# EAGLE design ASCEND_Logger (EAGLE 9.7.0)
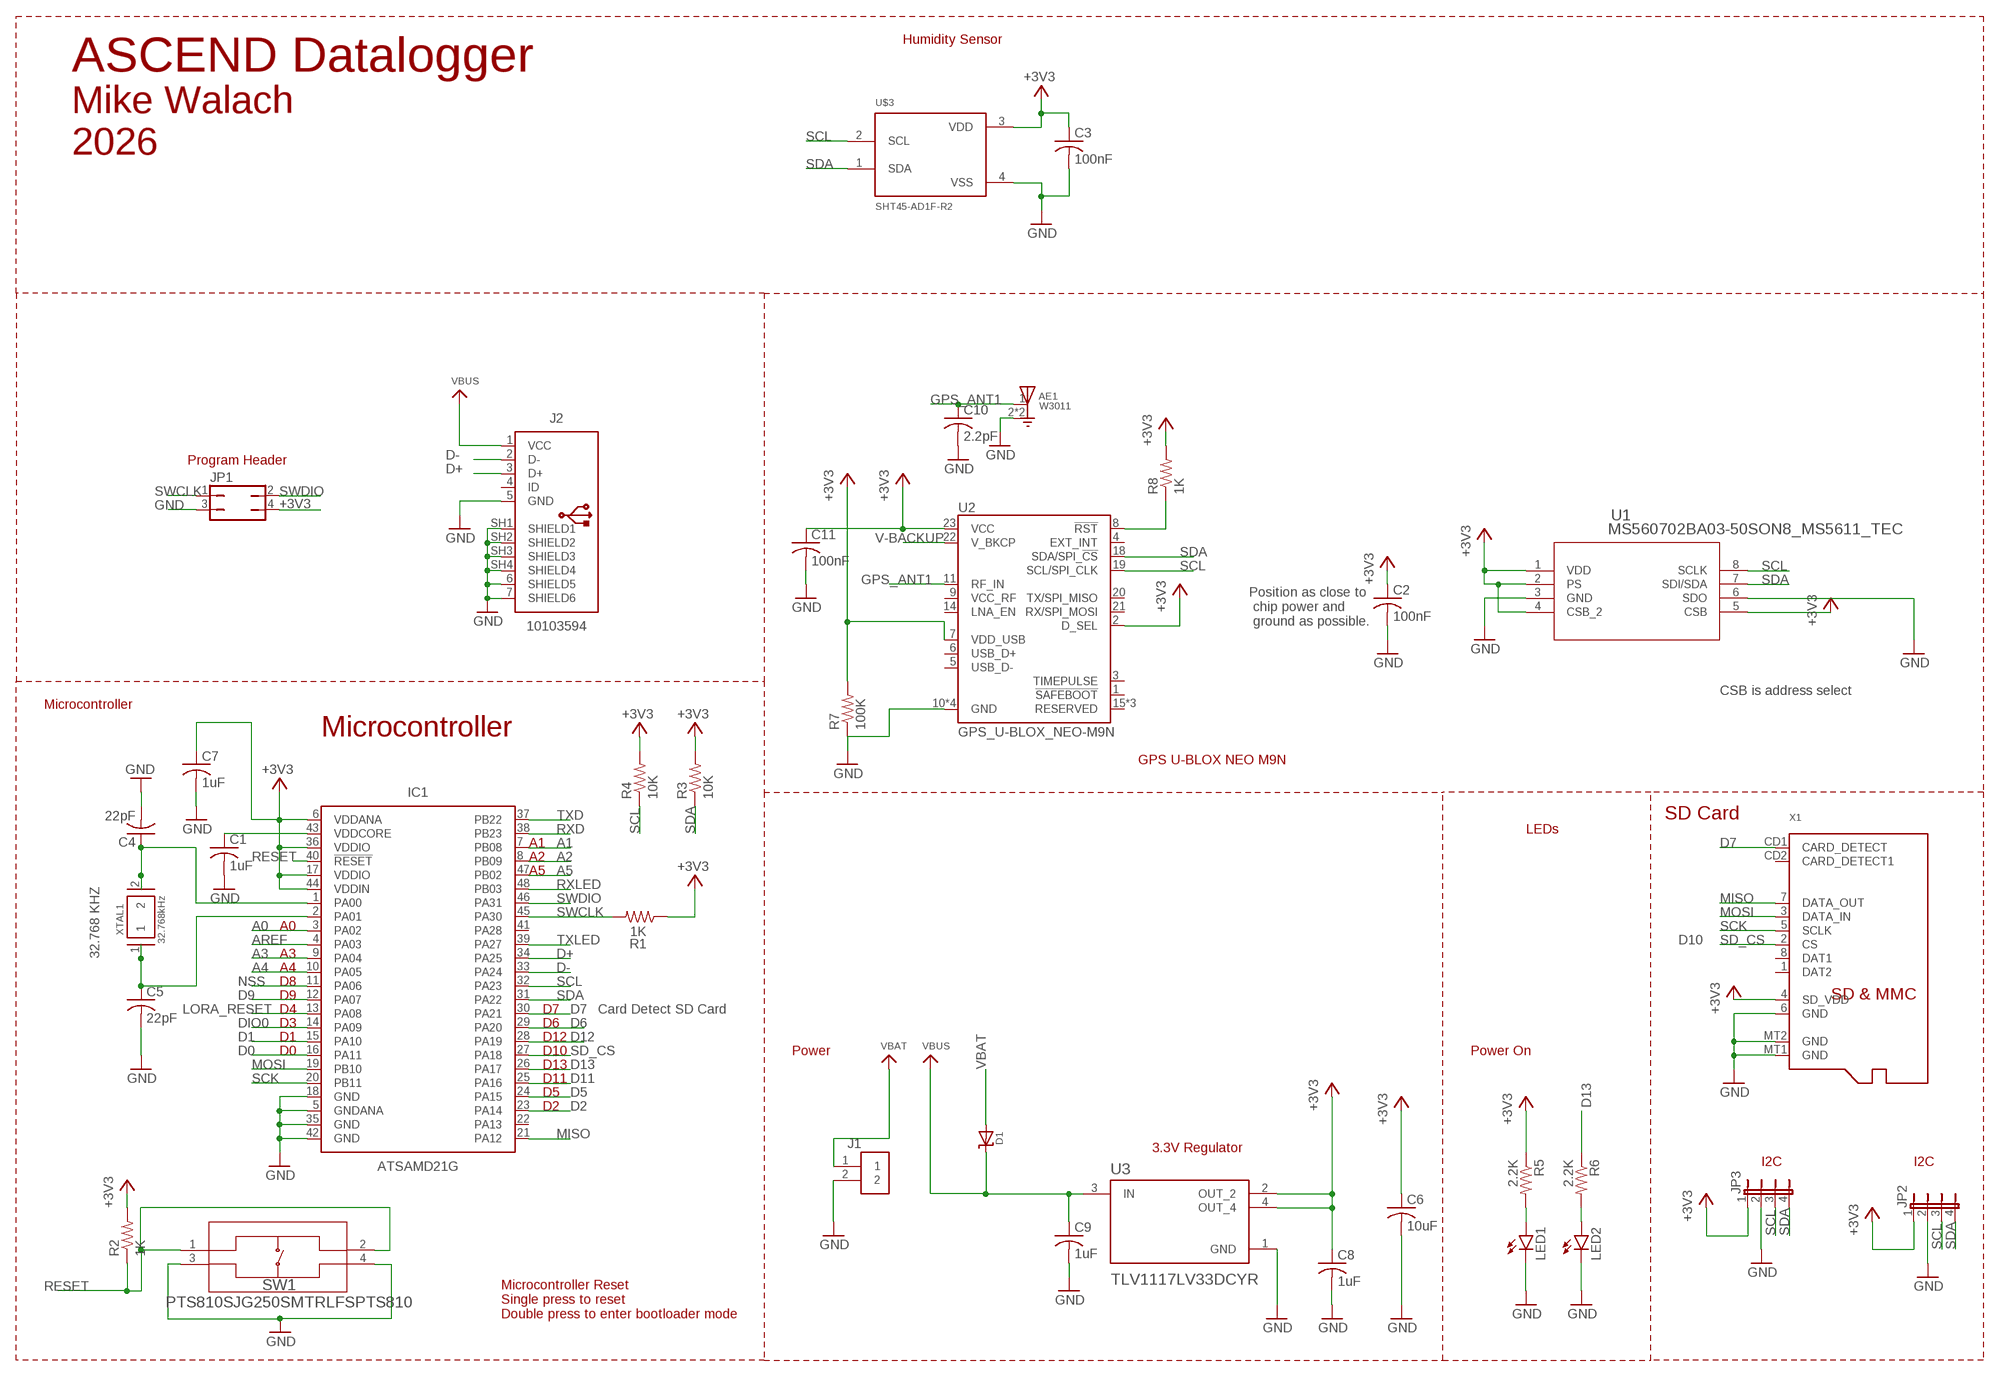
[diagram p0: schematic, sheet 1]

## Parts
AE1  W3011  [XDCR_W3011]
C1  1uF  C-USC0805  [C0805]
C2  100nF  C-USC0805  [C0805]
C3  100nF  C-USC0805  [C0805]
C4  22pF  C-USC0805  [C0805]
C5  22pF  C-USC0805  [C0805]
C6  10uF  C-USC0805  [C0805]
C7  1uF  C-USC0805  [C0805]
C8  1uF  C-USC0805  [C0805]
C9  1uF  C-USC0805  [C0805]
C10  2.2pF  C-USC0805  [C0805]
C11  100nF  C-USC0805  [C0805]
D1  MICROBUILDER_DIODE-SCHOTTKYSOD-123  [MICROBUILDER_SOD-123]
IC1  ATSAMD21G  ATSAMD21G_TQFP  [QFP50P900X900X120-48]
J1  S2B-PH-K-S(LF)(SN)  [S2B-PH-K-S(LF)(SN)]
J2  10103594  [10103594]
JP1  JP2Q  [JP2Q]
JP2  JP4E  [JP4]
JP3  JP4E  [JP4]
LED1  LEDSML0805  [SML0805]
LED2  LEDSML0805  [SML0805]
R1  1K  R-US_R0805  [R0805]
R2  1K  R-US_R0805  [R0805]
R3  10K  R-US_R0805  [R0805]
R4  10K  R-US_R0805  [R0805]
R5  2.2K  R-US_R0805  [R0805]
R6  2.2K  R-US_R0805  [R0805]
R7  100K  R-US_R0805  [R0805]
R8  1K  R-US_R0805  [R0805]
SW1  PTS810SJG250SMTRLFSPTS810  [PTS810]
U1  MS560702BA03-50SON8_MS5611_TEC  [SON8_MS5611_TEC]
U2  GPS_U-BLOX_NEO-M9N  [GPS_NEO-M9N]
U3  TLV1117LV33DCYR  [VREG_TLV1117LV33DCYR]
U$3  SHT45-AD1F-R2  [SHT4X_HAND_SOLDER]
X1  MICROBUILDER_MICROSD  [MICROBUILDER_MICROSD]
XTAL1  32.768kHz  ABSO7  [XTAL_ABS07-32.768KHZ-T]

## Nets
+3V3: C2.1 C3.1 C6.1 C7.1 C8.1 C11.1 IC1.6(VDDANA) IC1.17(VDDIO) IC1.36(VDDIO) IC1.44(VDDIN) JP1.4 JP2.1 JP3.1 R1.1 R2.2 R3.2 R4.2 R5.1 R7.2 R8.2 U1.1(VDD) U1.2(PS) U1.4(CSB_2) U1.5(CSB) U2.2(D_SEL) U2.7(VDD_USB) U2.23(VCC) U3.2(OUT_2) U3.4(OUT_4) U$3.3(VDD) X1.4(SD_VDD)
A0: IC1.3(PA02)
A1: IC1.7(PB08)
A2: IC1.8(PB09)
A3: IC1.9(PA04)
A4: IC1.10(PA05)
A5: IC1.47(PB02)
AREF: IC1.4(PA03)
D0: IC1.16(PA11)
D1: IC1.15(PA10)
D2: IC1.23(PA14)
D5: IC1.24(PA15)
D6: IC1.29(PA20)
D7: IC1.30(PA21) X1.CD1(CARD_DETECT)
D9: IC1.12(PA07)
D11: IC1.25(PA16)
D12: IC1.28(PA19)
D13: IC1.26(PA17) R6.1
D+: IC1.34(PA25) J2.3(D+)
D-: IC1.33(PA24) J2.2(D-)
DIO0: IC1.14(PA09)
GND: AE1.2(GND) AE1.3(GND) C1.2 C2.2 C3.2 C4.2 C5.2 C6.2 C7.2 C8.2 C9.2 C10.2 C11.2 IC1.5(GNDANA) IC1.18(GND) IC1.35(GND) IC1.42(GND) J1.2 J2.5(GND) J2.6(SHIELD5) J2.7(SHIELD6) J2.SH1(SHIELD1) J2.SH2(SHIELD2) J2.SH3(SHIELD3) J2.SH4(SHIELD4) JP1.3 JP2.2 JP3.2 LED1.C LED2.C R7.1 SW1.3 SW1.4 U1.3(GND) U1.6(SDO) U2.10(GND) U2.12(GND) U2.13(GND) U2.24(GND) U3.1(GND) U$3.4(VSS) X1.6(GND) X1.MT1(GND) X1.MT2(GND)
GPS_ANT1: AE1.1(FEED) C10.1 U2.11(RF_IN)
LORA_RESET: IC1.13(PA08)
MISO: IC1.21(PA12) X1.7(DATA_OUT)
MOSI: IC1.19(PB10) X1.3(DATA_IN)
N$2: C1.1 IC1.43(VDDCORE)
N$8: LED2.A R6.2
N$11: R8.1 U2.8(!RST)
N$12: C5.1 IC1.2(PA01) XTAL1.1
N$15: C4.1 IC1.1(PA00) XTAL1.2
N$30: LED1.A R5.2
NSS: IC1.11(PA06)
RESET: IC1.40(!RESET) R2.1 SW1.1 SW1.2
RXD: IC1.38(PB23)
RXLED: IC1.48(PB03)
SCK: IC1.20(PB11) X1.5(SCLK)
SCL: IC1.32(PA23) JP2.3 JP3.3 R4.1 U1.8(SCLK) U2.19(SCL/SPI_CLK) U$3.2(SCL)
SD_CS: IC1.27(PA18) X1.2(CS)
SDA: IC1.31(PA22) JP2.4 JP3.4 R3.1 U1.7(SDI/SDA) U2.18(SDA/SPI_!CS!) U$3.1(SDA)
SWCLK: IC1.45(PA30) JP1.1 R1.2
SWDIO: IC1.46(PA31) JP1.2
TXD: IC1.37(PB22)
TXLED: IC1.39(PA27)
V-BACKUP: U2.22(V_BKCP)
VBAT: D1.A J1.1
VBUS: C9.1 D1.C J2.1(VCC) U3.3(IN)
Unconnected: IC1.22(PA13) IC1.41(PA28) J2.4(ID) U2.1(!SAFEBOOT!) U2.3(TIMEPULSE) U2.4(EXT_INT) U2.5(USB_D-) U2.6(USB_D+) U2.9(VCC_RF) U2.14(LNA_EN) U2.15(RESERVED) U2.16(RESERVED) U2.17(RESERVED) U2.20(TX/SPI_MISO) U2.21(RX/SPI_MOSI) X1.1(DAT2) X1.8(DAT1) X1.CD2(CARD_DETECT1)

## Notes on the sheet
- Humidity Sensor
- ASCEND Datalogger
- Mike Walach
  2026
- Program Header
- Position as close to
   chip power and
   ground as possible.
- CSB is address select
- Microcontroller
- Microcontroller
- GPS U-BLOX NEO M9N
- SD Card
- LEDs
- A1
- A2
- A5
- A0
- D10
- 32.768 KHZ | A3
- A4
- D8
- D9
- D4 | D7 | Card Detect SD Card
- D3 | D6
- D1 | D12
- D0 | D10 | Power | Power On
- D13
- D11
- D5
- D2
- 3.3V Regulator
- I2C | I2C
- Microcontroller Reset
  Single press to reset
  Double press to enter bootloader mode

## Library data of the parts
AE1 = W3011:W3011: Antenna Ceramic 3.4dB Gain 1585.42MHz SMD; MANUFACTURER: PulseLarsen; MAXIMUM_PACKAGE_HEIGHT: 1.3 mm; PARTREV: N/A; STANDARD: Manufacturer recommendations
C1-C11 = rcl:C-US: CAPACITOR, American symbol; SPICEPREFIX: C
D1 = flightcomputer-2023:MICROBUILDER_DIODE-SCHOTTKY
IC1 = IC_Embedded:ATSAMD21G*: 32-bit ARM-Based Microcontrollers Datasheet <http://ww1.microchip.com/downloads/en/devicedoc/40001884a.pdf> Note:For this part User needs to add thermal via in thermal pad in QFN package while designing a board.; CATEGORY: IC_Embedded; CORE: ARM Cortex M0+; DESCRIPTION: Low-power, high-performance Microchip's ARM® Cortex®-M0+ based flash microcontroller; MANUFACTURER: Microchip Technology; MPN: ATSAMD21G; OPERATING_TEMP: variable; PACKAGE: TQFP-48; PART_STATUS: Active; ROHS_COMPLIANT: COMPLIANT; SERIES: SAM D21G; SUB-CATEGORY: Microcontroller; TYPE: 32 bit Microcontroller
J1 = Connectors:S2B-PH-K-S(LF)(SN): CONN HEADER R/A 2POS 2MM Manufacturer's datasheet <http://www.jst-mfg.com/product/pdf/eng/ePH.pdf>; CREATED_BY: PCBLayout.com; DIGI_KEY_PART_NUMBER: 455-1719-ND; MANUFACTURER: JST Sales America Inc.; MPN: S2B-PH-K-S(LF)(SN)
J2 = Connector_USB:10103594: USB(2.0) Micro-B, RCPT, 5POS, SMD-THT-R/A Datasheet <https://cdn.amphenol-icc.com/media/wysiwyg/files/documentation/datasheet/inputoutput/io_usb_micro.pdf> Drawing <https://cdn.amphenol-icc.com/media/wysiwyg/files/drawing/10103594.pdf>; CATEGORY: Connectors; CONTACTS: 5; CURRENT-RATING: 1.8A; DESCRIPTION: CONN RCPT USB2.0 MICRO B SMD R/A; GENDER: Receptacle; MANUFACTURER: Amphenol ICC (FCI); MOUNT_TYPE: R/A; MPN: 10103594-0001LF; OPERATING_TEMPERATURE: -30°C ~ 80°C; PART_STATUS: ACTIVE; ROHS_COMPLIANT: COMPLIANT; SUB_CATEGORY: USB; TYPE: USB-micro B; VOLTAGE-RATING: 100VAC
JP1 = jumper:JP2Q: JUMPER
JP2 JP3 = jumper:JP4E: JUMPER
LED1 LED2 = led:LED: LED OSRAM: - CHIPLED LG R971, LG N971, LY N971, LG Q971, LY Q971, LO R971, LY R971 LH N974, LH R974 LS Q976, LO Q976, LY Q976 LO Q996 - Hyper CHIPLED LW Q18S LB Q993, LB Q99A, LB R99A - SideLED LS A670, LO A670, LY A670, LG A670, LP A670 LB A673, LV A673, LT A673, LW A673 LH A674 LY A675 LS A676, LA A676, LO A676, LY A676, LW A676 LS A679, LY A679, LG A679 - Hyper Micro SIDELED® LS Y876, LA Y876, LO Y876, LY Y876 LT Y87S - SmartLED LW L88C, LW L88S LB L89C, LB L89S, LG L890 LS L89K, LO L89K, LY L89K LS L896, LA L896, LO L896, LY L896 - TOPLED LS T670, LO T670, LY T670, LG T670, LP T670 LSG T670, LSP T670, LSY T670, LOP T670, LYG T670 LG T671, LOG T671, LSG T671 LB T673, LV T673, LT T673, LW T673 LH T674 LS T676, LA T676, LO T676, LY T676, LB T676, LH T676, LSB T676, LW T676 LB T67C, LV T67C, LT T67C, LS T67K, LO T67K, LY T67K, LW E67C LS E67B, LA E67B, LO E67B, LY E67B, LB E67C, LV E67C, LT E67C LW T67C LS T679, LY T679, LG T679 LS T770, LO T770, LY T770, LG T770, LP T770 LB T773, LV T773, LT T773, LW T773 LH T774 LS E675, LA E675, LY E675, LS T675 LS T776, LA T776, LO T776, LY T776, LB T776 LHGB T686 LT T68C, LB T68C - Hyper Mini TOPLED® LB M676 - Mini TOPLED Santana® LG M470 LS M47K, LO M47K, LY M47K Source: http://www.osram.convergy.de LUXEON: - LUMILED® LXK2-PW12-R00, LXK2-PW12-S00, LXK2-PW14-U00, LXK2-PW14-V00 LXK2-PM12-R00, LXK2-PM12-S00, LXK2-PM14-U00 LXK2-PE12-Q00, LXK2-PE12-R00, LXK2-PE12-S00, LXK2-PE14-T00, LXK2-PE14-U00 LXK2-PB12-K00, LXK2-PB12-L00, LXK2-PB12-M00, LXK2-PB14-N00, LXK2-PB14-P00, LXK2-PB14-Q00 LXK2-PR12-L00, LXK2-PR12-M00, LXK2-PR14-Q00, LXK2-PR14-R00 LXK2-PD12-Q00, LXK2-PD12-R00, LXK2-PD12-S00 LXK2-PH12-R00, LXK2-PH12-S00 LXK2-PL12-P00, LXK2-PL12-Q00, LXK2-PL12-R00 Source: www.luxeon.com KINGBRIGHT: KA-3528ASYC Source: www.kingbright.com
R1-R8 = rcl:R-US_: RESISTOR, American symbol; SPICEPREFIX: R
SW1 = 2024-06-17_17-27-14_Library:PTS810SJG250SMTRLFS; COPYRIGHT: Copyright (C) 2024 Ultra Librarian. All rights reserved.; MANUFACTURER_PART_NUMBER: PTS810SJG250SMTRLFS; MFR_NAME: C&K Components
U1 = 2025-03-19_19-02-07_Library:MS560702BA03-50; COPYRIGHT: Copyright (C) 2025 Ultra Librarian. All rights reserved.; MANUFACTURER_PART_NUMBER: MS560702BA03-50; MFR_NAME: TE Connectivity
U2 = SparkFun GPS NEO_M9N_ANT:GPS_U-BLOX_NEO-M9N: u-blox NEO-M9N GPS Module The NEO-M9N module is built on the robust u-blox M9 GNSS chip, which provides exceptional sensitivity and acquisition times for all L1 GNSS systems. The u-blox M9 standard precision GNSS platform, which delivers meter-level accuracy, succeeds the well-known u-blox M8 product range. The receiver also provides higher navigation rate and improved security features compared to previous u-blox GNSS generations. The NEO-M9N module is available in the NEO form factor LLC package; PROD_ID: IC-14651
U3 = TLV1117LV33DCYR:TLV1117LV33DCYR; MANUFACTURER: Texas Instruments; MAXIMUM_PACKAGE_HEIGHT: 1.80 mm; PARTREV: B; STANDARD: IPC-7351B
U$3 = SHT45-AD1F-R2_HAND_SOLDER:SHT45-AD1F-R2
X1 = flightcomputer-2023:MICROBUILDER_MICROSD: MicroSD/Transflash Card Holder with SPI pinout 3M: 2908-05WB-MG 4UConnector: 19656 Footprint courtesy: Adafruit Industries
XTAL1 = Crystal-WA:ABSO7: CRYSTAL 32.7680KHZ 12.5PF SMD Datasheet <https://abracon.com/Resonators/ABS07.pdf>; CATEGORY: Crystal; MANUFACTURER: Abracon LLC; MPN: ABS07-32.768KHZ-T; OPERATING_TEMPERATURE: -40°C ~ 85°C; PART_STATUS: ACTIVE; ROHS_COMPLIANT: COMPLIANT; SERIES: ABS07; SUB_CATEGORY: Crystal Surface Mount; TYPE: Crystal

## Board
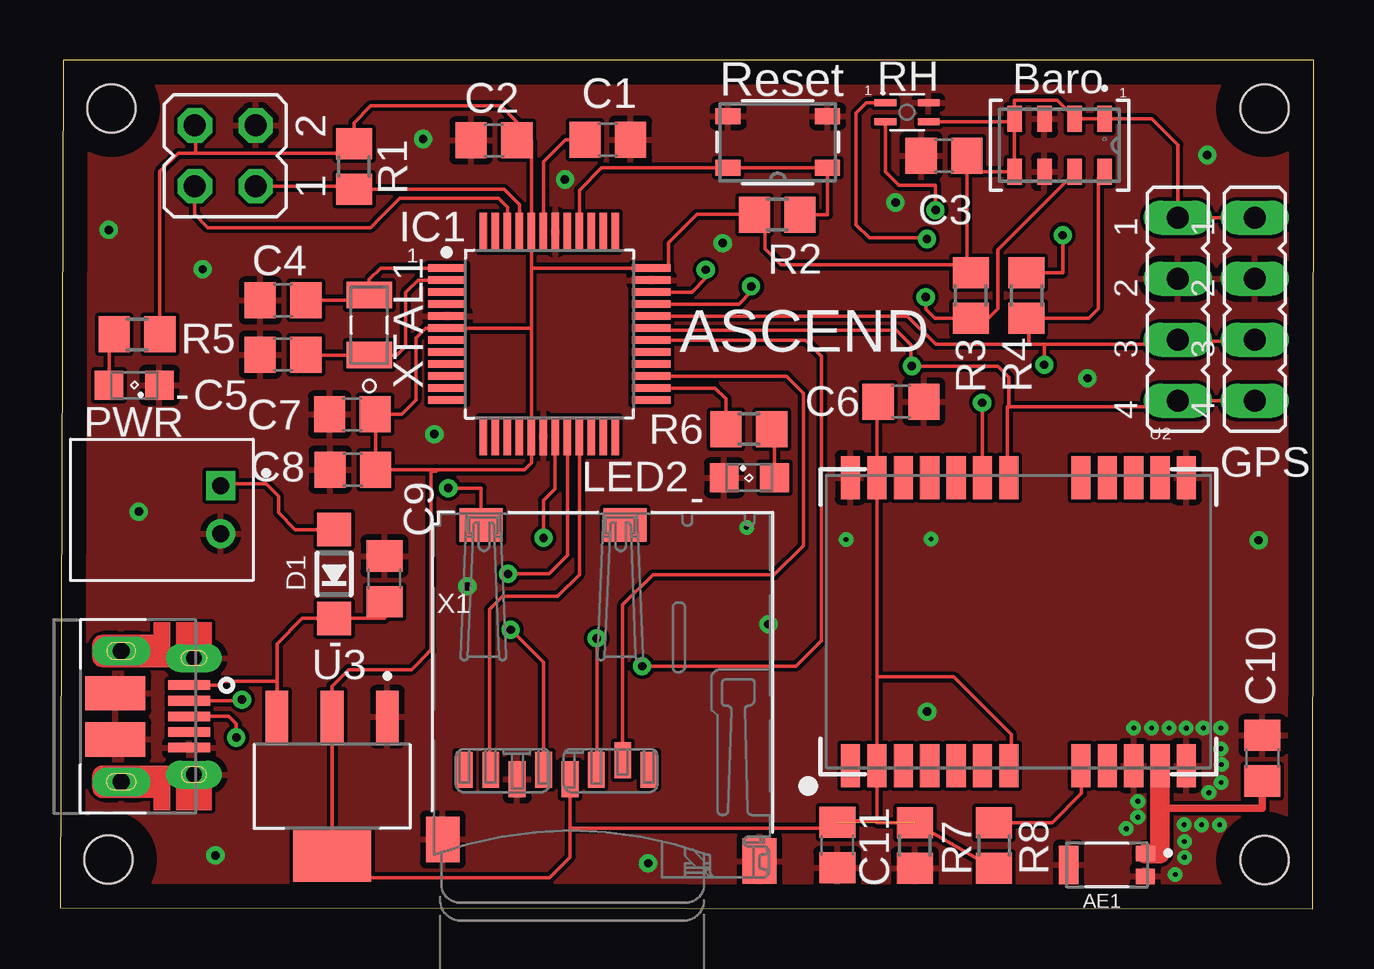
[diagram p1: board, top side]
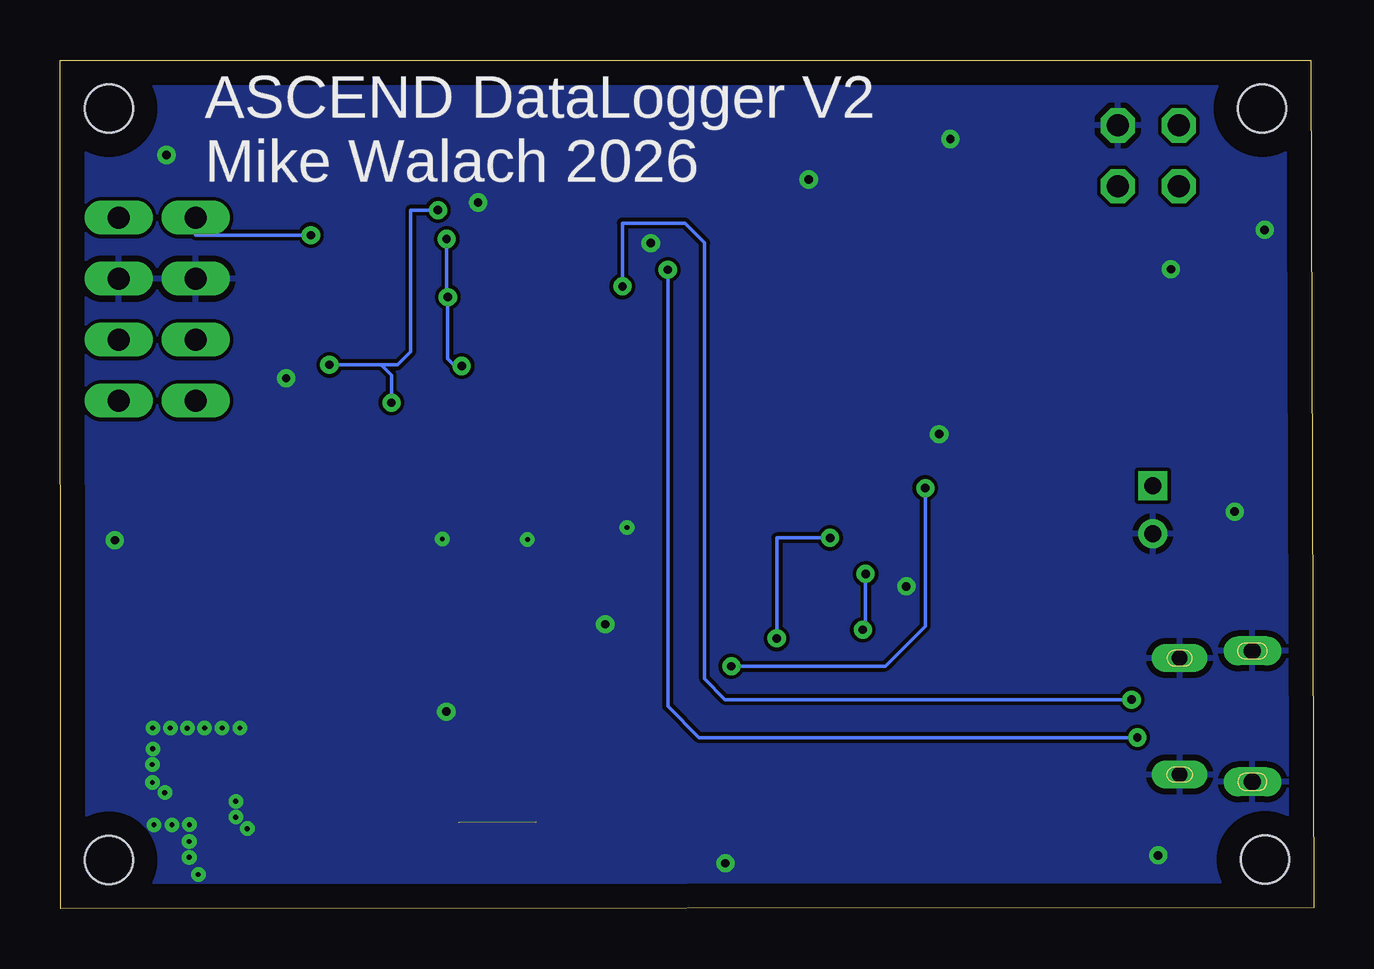
[diagram p2: board, bottom side, seen from below]

Size 52.25 x 35.36 mm. Coordinates in mm from the lower left corner, seen from the top.
Outline: 0,0.03 52.23,0 52.25,35.36 0.13,35.36 0,0.03
Copper layers (1*16): Top 0.035mm / dielectric 1.5mm / Bottom 0.035mm
Design rules "Fusion Electronics Design Rules": minimum track width 6mil, minimum drill 0.35mm, track to track 6mil, track to pad 6mil, pad to pad 6mil, via to via 6mil, smd to smd 6mil, copper to edge 40mil, drill to drill 6mil, minimum pad ring 10mil, minimum via ring 8mil, stop-mask expansion 4mil, vias tented up to drill 0mil, thermal gap 10mil
Holes 2 mm at 50.21,2.02 2.14,33.34 2.03,2.05 50.21,33.34

### Footprints (pad centres in the part's own frame; a part is rotated, then mirrored left to right if it is on the bottom)
XDCR_W3011 = smd 0.65 x 0.8: 1 -0.475,1.6; 2 0.475,1.6 | smd 1.6 x 0.8: 3 0,-1.6
C0805 = smd 1.3 x 1.5: 1 -0.95,0; 2 0.95,0
MICROBUILDER_SOD-123 = smd 1.4 x 1.4: A 1.85,0; C -1.85,0
QFP50P900X900X120-48 = smd 1.6 x 0.3: 1 -4.25,2.75; 2 -4.25,2.25; 3 -4.25,1.75; 4 -4.25,1.25; 5 -4.25,0.75; 6 -4.25,0.25; 7 -4.25,-0.25; 8 -4.25,-0.75; 9 -4.25,-1.25; 10 -4.25,-1.75; 11 -4.25,-2.25; 12 -4.25,-2.75; 25 4.25,-2.75; 26 4.25,-2.25; 27 4.25,-1.75; 28 4.25,-1.25; 29 4.25,-0.75; 30 4.25,-0.25; 31 4.25,0.25; 32 4.25,0.75; 33 4.25,1.25; 34 4.25,1.75; 35 4.25,2.25; 36 4.25,2.75 | smd 0.3 x 1.6: 13 -2.75,-4.25; 14 -2.25,-4.25; 15 -1.75,-4.25; 16 -1.25,-4.25; 17 -0.75,-4.25; 18 -0.25,-4.25; 19 0.25,-4.25; 20 0.75,-4.25; 21 1.25,-4.25; 22 1.75,-4.25; 23 2.25,-4.25; 24 2.75,-4.25; 37 2.75,4.25; 38 2.25,4.25; 39 1.75,4.25; 40 1.25,4.25; 41 0.75,4.25; 42 0.25,4.25; 43 -0.25,4.25; 44 -0.75,4.25; 45 -1.25,4.25; 46 -1.75,4.25; 47 -2.25,4.25; 48 -2.75,4.25
S2B-PH-K-S(LF)(SN) = drill 0.7 square: 1 -1,0 | drill 0.7: 2 1,0
10103594 = smd 0.4 x 1.75: 1 -1.3,2.825; 2 -0.65,2.825; 3 0,2.825; 4 0.65,2.825; 5 1.3,2.825 | smd 1.425 x 2.5: 6 -0.963,-0.25; 7 0.963,-0.25 | drill 0.65 pad 0.73 long: SH1 -2.425,3.03; SH2 2.425,3.03 | drill 0.7 long: SH3 -2.725,0; SH4 2.725,0
JP2Q = drill 0.914 octagon: 1 -1.27,-1.27; 2 -1.27,1.27; 3 1.27,-1.27; 4 1.27,1.27
JP4 = drill 0.914 long: 1 -3.81,0; 2 -1.27,0; 3 1.27,0; 4 3.81,0
SML0805 = smd 1.2 x 1.2: A 1.05,0; C -1.05,0
R0805 = smd 1.3 x 1.5: 1 -0.95,0; 2 0.95,0
PTS810 = smd 1.041 x 0.66: 1 -2.075,1.075; 2 2.075,1.075; 3 -2.075,-1.075; 4 2.075,-1.075
SON8_MS5611_TEC = smd 1.092 x 0.61: 1 -1.1,1.875; 2 -1.1,0.625; 3 -1.1,-0.625; 4 -1.1,-1.875; 5 1.1,-1.875; 6 1.1,-0.625; 7 1.1,0.625; 8 1.1,1.875
GPS_NEO-M9N = smd 1.8 x 0.8: 1 6,-7; 2 6,-5.9; 3 6,-4.8; 4 6,-3.7; 5 6,-2.6; 6 6,-1.5; 7 6,-0.4; 8 6,2.6; 9 6,3.7; 10 6,4.8; 11 6,5.9; 12 6,7; 13 -6,7; 14 -6,5.9; 15 -6,4.8; 16 -6,3.7; 17 -6,2.6; 18 -6,-0.4; 19 -6,-1.5; 20 -6,-2.6; 21 -6,-3.7; 22 -6,-4.8; 23 -6,-5.9; 24 -6,-7
VREG_TLV1117LV33DCYR = smd 2.15 x 0.95: 1 -2.9,2.3; 2 -2.9,0; 3 -2.9,-2.3 | smd 2.15 x 3.25: 4 2.9,0
SHT4X_HAND_SOLDER = smd 0.9 x 0.3: 1 -0.9,0.4; 2 -0.9,-0.4; 3 0.9,-0.4; 4 0.9,0.4
MICROBUILDER_MICROSD = smd 0.7 x 1.5: 1 9,-10.64; 2 7.9,-10.24; 3 6.8,-10.64; 4 5.7,-11.04; 5 4.6,-10.64; 6 3.5,-11.04; 7 2.4,-10.64; 8 1.3,-10.64 | smd 1.8 x 1.4: CD1 2,-0.44; CD2 8,-0.44 | smd 1.4 x 1.9: MT1 0.4,-13.54; MT2 13.6,-14.44
XTAL_ABS07-32.768KHZ-T = smd 1.1 x 1.9: 1 -1.25,0; 2 1.25,0

### Placement (x,y rotation side)
AE1  43.64,1.82 270 top
C1  22.83,32.04 0 top
C2  18.09,32.01 180 top
C3  36.85,31.37 180 top
C4  9.3,25.35 180 top
C5  9.3,23.09 180 top
C6  35.06,21.13 0 top
C7  12.19,20.59 180 top
C8  12.21,18.29 180 top
C9  13.52,13.74 90 top
C10  50.12,6.27 90 top
C11  32.4,2.65 270 top
D1  11.43,13.95 90 top
IC1  20.4,23.94 0 top
J1  6.7,16.62 270 top
J2  2.55,8.01 270 top
JP1  6.89,31.36 90 top
JP2  46.59,24.98 270 top
JP3  49.8,24.98 270 top
LED1  3.09,21.81 180 top
LED2  28.74,17.96 0 top
R1  12.25,30.92 270 top
R2  29.89,28.92 180 top
R3  37.96,25.54 90 top
R4  40.29,25.54 90 top
R5  3.22,23.93 180 top
R6  28.72,19.98 0 top
R7  35.63,2.63 90 top
R8  38.94,2.63 270 top
SW1  29.92,31.94 180 top
U1  41.66,31.81 270 top
U2  39.95,11.96 270 top
U3  11.34,5.1 270 top
U$3  35.31,33.18 0 top
X1  15.56,16.42 0 top
XTAL1  12.89,24.31 90 top

### Tracks (layer width: path | path; a pad name or v marks a point on that pad's centre or on a via)
+3V3  (via drill 0.35)  (1 unrouted)
  Top 0.152: 15.68,18.29 C8.1 13.16,20.59 C7.1 14.24,20.6 14.84,21.2 14.84,23.78 15.25,24.19 IC1.6 19.65,24.19 | 15.68,18.29 19.36,18.29 19.65,18.58 IC1.17 19.65,24.19 | U1.4 U1.5 37.8,30.71 | JP3.1 JP2.1 46.59,31.83 45.52,32.91 U1.1 U1.2 42.29,32.97 41.56,33.69 39.79,33.69 U1.4 | 34.05,3.66 U2.2 34.05,9.66 | 34.05,3.66 34.05,3.58 R7.2 | 34.05,9.66 37.26,9.66 39.65,7.27 39.65,5.96 U2.7 | 38.94,1.91 R8.2 R7.2 | R7.2 | 34.05,3.66 32.4,3.66 32.4,3.35 21.26,3.35 | C6.1 34.05,21.13 U2.23 34.05,9.66 | R5.1 4.16,30.72 4.92,31.47 5.65,31.47 | 5.65,31.47 5.65,32.63 JP1.4 | 5.65,31.47 12.25,31.47 R1.1 12.25,32.76 12.95,33.45 18.38,33.45 19.04,32.79 C2.1 19.65,32.01 IC1.44 19.65,26.69 | 19.65,26.69 IC1.36 25.36,26.69 25.36,27.74 26.55,28.93 R2.2 29.38,28.92 29.38,27.5 30.05,26.83 37.96,26.83 R3.2 37.8,26.49 37.8,30.71 | 19.65,24.19 19.65,26.69 | 21.26,3.35 21.26,2.14 20.41,1.29 11.34,1.29 U3.4 U3.2 11.34,9.28 12.03,9.96 14.66,9.96 15.48,10.78 15.48,18.23 15.68,18.23 15.68,18.29 | R4.2 41.8,26.49 v41.8,28.06 | X1.4 21.26,3.35 | U$3.3 39.67,32.78 U1.4 | 37.8,30.71 C3.1
  Bottom 0.152: v41.8,28.06 46.59,28.06 JP2.1
D7  (via drill 0.35)
  Top 0.152: IC1.30 31.07,23.69 31.75,23.02 31.75,11.17 30.68,10.1 v24.27,10.1 | v16.19,17.52 17.56,17.52 X1.CD1
  Bottom 0.152: v24.27,10.1 17.86,10.1 16.19,11.77 v16.19,17.52
D13
  Top 0.152: IC1.26 27.31,21.69 27.77,21.24 R6.1
D+  (via drill 0.35)
  Top 0.152: J2.3 7.04,8.01 7.35,7.7 v7.35,7.13 | v26.92,26.62 26.92,26.27 26.34,25.69 IC1.34
  Bottom 0.152: v7.35,7.13 25.62,7.13 26.92,8.43 v26.92,26.62
D-  (via drill 0.35)
  Top 0.152: J2.2 7.59,8.66 v7.59,8.71 | IC1.33 28.3,25.19 28.81,25.7 v28.81,25.93
  Bottom 0.152: v7.59,8.71 24.53,8.71 25.39,9.57 25.39,27.74 26.21,28.56 28.81,28.56 v28.81,25.93
GND  (via drill 0.2, 0.35)
  other vias: 21.05,30.38 15.14,32.07 27.63,27.73 16.98,13.43 29.53,11.85 36.15,8.21 49.97,15.35 34.83,29.42 47.82,31.4 42.83,22.1 15.61,19.77 2.04,28.28 5.95,26.64 3.29,16.54 6.48,2.22 24.52,1.89 46.49,1.42 46.87,2.14 46.87,2.8 46.86,3.5 44.45,3.33 44.93,3.81 44.93,4.47 44.76,7.53 45.5,7.53 46.23,7.53 46.95,7.52 47.66,7.53 48.39,7.53 48.39,6.66 48.41,6.01 48.4,5.26 47.89,4.83 47.59,3.49 48.34,3.49 28.62,15.88 32.77,15.38 36.32,15.4
  pour Top: -1.2,-3.42 54.08,-3.42 54.08,37.71 -1.2,37.71
  pour Bottom: -1.3,-4.11 53.98,-4.11 53.98,37.9 -1.3,37.9
GPS_ANT1
  Top 0.305: C10.1 50.12,4.19 45.85,4.19
  Top 0.813: U2.11 45.85,4.19 45.85,2.3 AE1.1
MISO
  Top 0.152: IC1.21 21.65,13.92 20.74,13.01 18.45,13.01 17.91,12.47 17.91,5.78 X1.7
MOSI  (via drill 0.35)
  Top 0.152: IC1.19 20.64,17.5 20.39,17.25 20.16,17.02 v20.16,15.45 | v22.38,11.26 22.38,5.8 X1.3
  Bottom 0.152: v20.16,15.45 22.38,15.45 v22.38,11.26
N$2
  Top 0.152: C1.1 21.07,32.04 20.15,31.12 IC1.43
N$8
  Top 0.152: R6.2 29.79,19.98 LED2.A
N$11
  Top 0.152: R8.1 | R8.1 41.36,3.58 42.58,4.8 42.58,5.96 U2.8
N$12
  Top 0.152: IC1.2 14.93,26.19 14.42,25.68 14.42,23.44 14.04,23.06 XTAL1.1 10.25,23.06 C5.1
N$15
  Top 0.152: IC1.1 13.37,26.69 12.89,26.21 XTAL1.2 12.89,25.35 C4.1
N$30
  Top 0.152: LED1.A 2.04,23.93 R5.2
RESET
  Top 0.152: IC1.40 21.65,29.93 22.58,30.86 SW1.2 SW1.1 31.99,28.92 R2.1
SCK  (via drill 0.35)
  Top 0.152: IC1.20 21.15,14.72 20.38,13.95 v18.68,13.95 | v18.79,11.62 v18.8,11.62 20.15,10.27 X1.5
  Bottom 0.152: v18.68,13.95 18.68,11.62 v18.79,11.62
SCL  (via drill 0.35)
  Top 0.152: 40.38,23.51 41.03,23.51 | 41.03,23.51 46.59,23.51 46.59,23.65 | 46.59,23.65 JP2.3 | 40.38,23.51 40.38,24.59 R4.1 42.88,24.59 43.28,24.99 43.28,30.45 U1.8 | U2.19 38.45,21.08 v38.44,21.08 | v41.03,22.66 41.03,23.51 | 40.38,23.51 36.52,23.51 35.33,24.69 IC1.32 | JP3.3 49.8,23.65 46.59,23.65 | U$3.2 34.41,30.7 34.96,30.14 36.5,30.14 v36.5,29.1
  Bottom 0.152: v38.44,21.08 38.44,22.22 38.88,22.66 | 38.88,22.66 v41.03,22.66 | 38.88,22.66 38.19,22.66 37.64,23.21 37.64,29.1 v36.5,29.1
SD_CS
  Top 0.152: X1.2 23.46,12.65 24.72,13.91 29.77,13.91 30.99,15.13 30.99,21.48 30.28,22.18 24.66,22.18 IC1.27
SDA  (via drill 0.35)
  Top 0.152: JP2.4 | JP2.4 46.59,20.91 39.56,20.91 | 39.56,20.91 39.5,20.91 39.5,17.96 U2.18 | IC1.31 24.65,24.11 34.87,24.11 35.48,23.5 35.48,22.61 v35.51,22.61 39.09,22.61 39.56,22.14 39.56,20.91 | v36.09,25.48 36.09,24.98 36.48,24.59 R3.1 38.69,24.59 39.09,24.99 39.09,27.45 42.29,30.65 U1.7 | JP3.4 JP2.4 | U$3.1 33.62,33.58 33.19,33.15 33.19,28.5 33.74,27.95 36.14,27.95 v36.14,27.9
  Bottom 0.152: v35.51,22.61 35.79,22.61 36.09,22.91 v36.09,25.48 36.14,25.48 v36.14,27.9
SWCLK
  Top 0.152: JP1.1 12.25,30.09 R1.2 18.51,29.97 19.15,29.34 IC1.45
SWDIO
  Top 0.152: IC1.46 18.65,29.22 18.28,29.59 14.16,29.59 13.42,28.85 12.95,28.38 6.17,28.38 5.61,28.94 5.61,30.09 JP1.2
VBAT
  Top 0.152: D1.A 9.81,15.8 9.11,16.5 9.11,17.18 8.59,17.7 6.7,17.7 J1.1
VBUS
  Top 0.152: C9.1 13.52,12.1 D1.C 10.09,12.1 9.04,11.05 U3.3 9.04,9.47 6.77,9.47 6.61,9.31 J2.1
(copper drawn outside any net)
  shapes: Bottom area x1, Top area x1

### Text on the board
tNames: RH | Baro | Reset | 1 | 1 | 1 | ASCEND | - | PWR | GPS | - | -
bNames: ASCEND DataLogger V2 / Mike Walach 2026